# Altium schematic sheet Fliptris_Schematic2.SchDoc
size A3
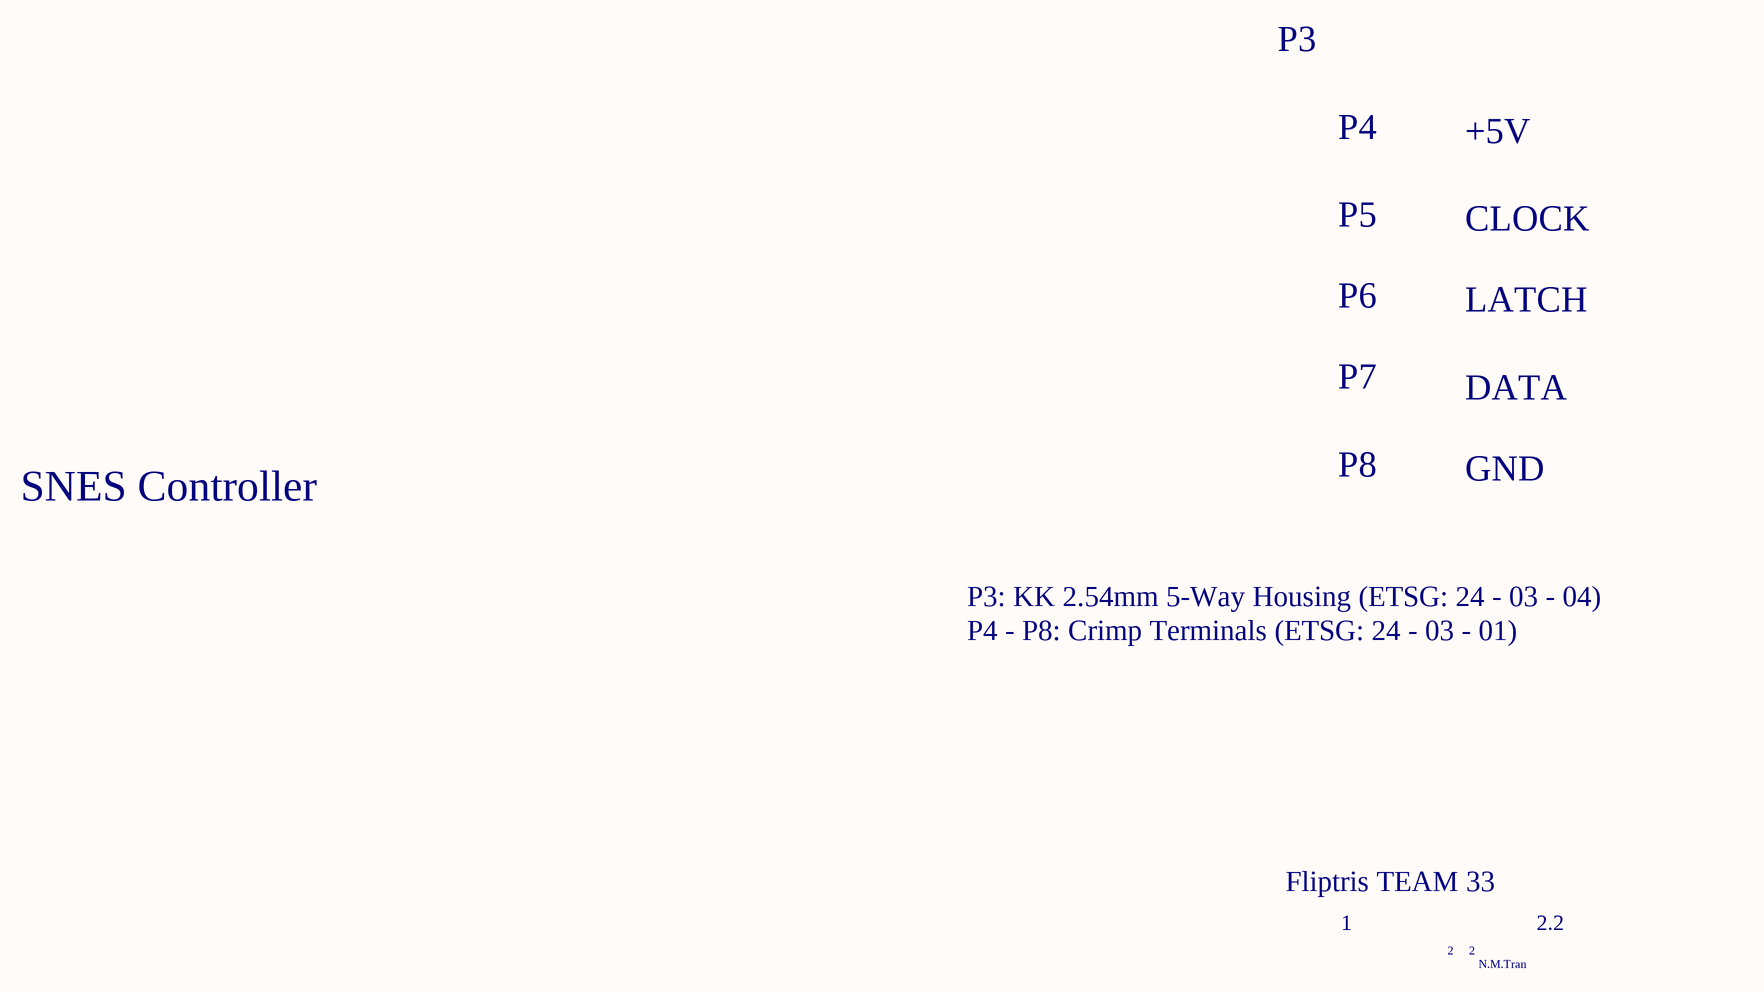
[diagram p0: Fliptris_Schematic2.SchDoc]

## Notes on the sheet
- P3
- P4
- +5V
- P5
- CLOCK
- P6
- LATCH
- P7
- DATA
- P8
- GND
- SNES Controller
- P3: KK 2.54mm 5-Way Housing (ETSG: 24 - 03 - 04)
- P4 - P8: Crimp Terminals (ETSG: 24 - 03 - 01)
- Fliptris TEAM 33
- 1
- 2
- 2.2
- N.M.Tran